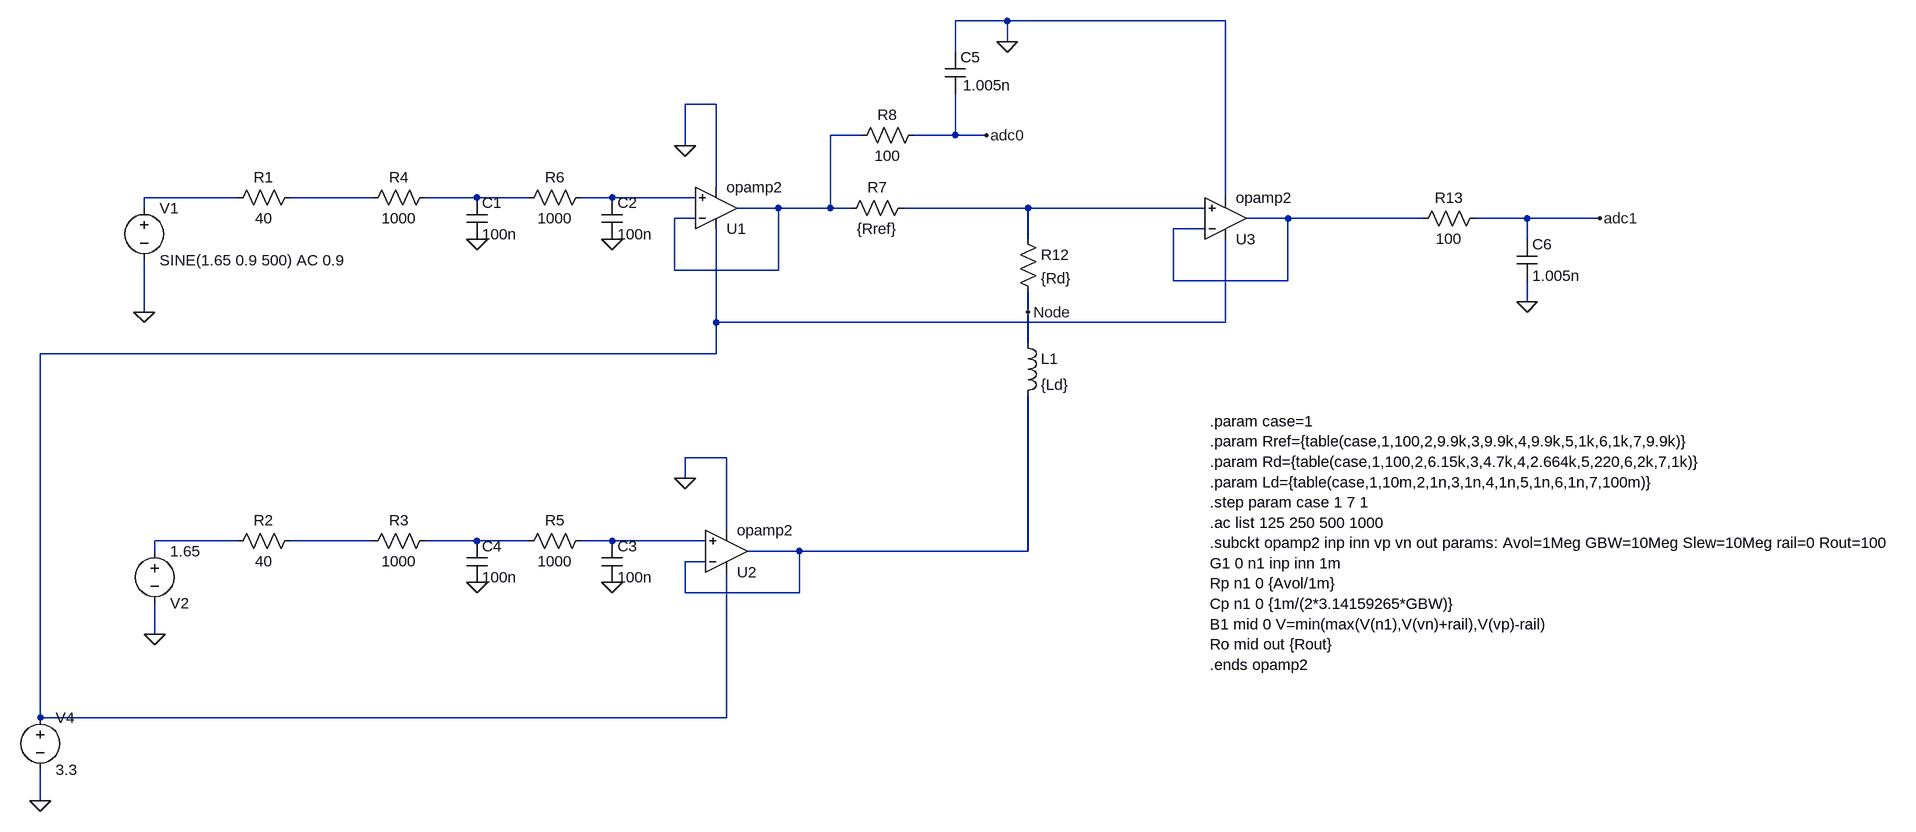
[diagram p0: schematic Impedence_Measurement.asc]
Impedence_Measurement.asc, the LTspice schematic file:
Version 4
SHEET 1 2552 900
WIRE 992 -320 912 -320
WIRE 1328 -320 992 -320
WIRE 992 -288 992 -320
WIRE 912 -272 912 -320
WIRE 544 -192 496 -192
WIRE 768 -144 720 -144
WIRE 912 -144 912 -208
WIRE 912 -144 848 -144
WIRE 960 -144 912 -144
WIRE 496 -128 496 -192
WIRE 544 -64 544 -192
WIRE -192 -48 -336 -48
WIRE 16 -48 -112 -48
WIRE 176 -48 96 -48
WIRE 256 -48 176 -48
WIRE 384 -48 336 -48
WIRE 512 -48 384 -48
WIRE 1328 -48 1328 -320
WIRE -336 -32 -336 -48
WIRE 640 -32 576 -32
WIRE 720 -32 720 -144
WIRE 720 -32 640 -32
WIRE 752 -32 720 -32
WIRE 1024 -32 832 -32
WIRE 1296 -32 1024 -32
WIRE 512 -16 480 -16
WIRE 1424 -16 1360 -16
WIRE 1632 -16 1424 -16
WIRE 1792 -16 1712 -16
WIRE 1904 -16 1792 -16
WIRE 1296 0 1248 0
WIRE 1024 16 1024 -32
WIRE 1792 16 1792 -16
WIRE 480 64 480 -16
WIRE 640 64 640 -32
WIRE 640 64 480 64
WIRE 1248 80 1248 0
WIRE 1424 80 1424 -16
WIRE 1424 80 1248 80
WIRE 1792 112 1792 80
WIRE -336 128 -336 48
WIRE 1024 128 1024 96
WIRE 544 144 544 0
WIRE 1328 144 1328 16
WIRE 1328 144 544 144
WIRE 1024 176 1024 128
WIRE 544 192 544 144
WIRE 544 192 -496 192
WIRE 560 352 496 352
WIRE 496 384 496 352
WIRE 560 464 560 352
WIRE -192 480 -320 480
WIRE 16 480 -112 480
WIRE 176 480 96 480
WIRE 256 480 176 480
WIRE 384 480 336 480
WIRE 528 480 384 480
WIRE -320 496 -320 480
WIRE 672 496 592 496
WIRE 1024 496 1024 256
WIRE 1024 496 672 496
WIRE 528 512 496 512
WIRE 496 560 496 512
WIRE 672 560 672 496
WIRE 672 560 496 560
WIRE -320 624 -320 576
WIRE -496 752 -496 192
WIRE 560 752 560 528
WIRE 560 752 -496 752
WIRE -496 880 -496 832
FLAG -320 624 0
FLAG -336 128 0
FLAG 176 16 0
FLAG 384 16 0
FLAG 176 544 0
FLAG 384 544 0
FLAG 992 -288 0
FLAG 1792 112 0
FLAG -496 880 0
FLAG 496 -128 0
FLAG 496 384 0
FLAG 960 -144 adc0
FLAG 1904 -16 adc1
FLAG 1024 128 Node
SYMBOL voltage -336 -48 R0
WINDOW 123 0 0 Left 0
WINDOW 39 0 0 Left 0
SYMATTR InstName V1
SYMATTR Value SINE(1.65 0.9 500) AC 0.9
SYMBOL res -96 -64 R90
WINDOW 0 0 56 VBottom 2
WINDOW 3 32 56 VTop 2
SYMATTR InstName R1
SYMATTR Value 40
SYMBOL res -96 464 R90
WINDOW 0 0 56 VBottom 2
WINDOW 3 32 56 VTop 2
SYMATTR InstName R2
SYMATTR Value 40
SYMBOL res 112 464 R90
WINDOW 0 0 56 VBottom 2
WINDOW 3 32 56 VTop 2
SYMATTR InstName R3
SYMATTR Value 1000
SYMBOL res 112 -64 R90
WINDOW 0 0 56 VBottom 2
WINDOW 3 32 56 VTop 2
SYMATTR InstName R4
SYMATTR Value 1000
SYMBOL res 352 464 R90
WINDOW 0 0 56 VBottom 2
WINDOW 3 32 56 VTop 2
SYMATTR InstName R5
SYMATTR Value 1000
SYMBOL res 352 -64 R90
WINDOW 0 0 56 VBottom 2
WINDOW 3 32 56 VTop 2
SYMATTR InstName R6
SYMATTR Value 1000
SYMBOL cap 160 -48 R0
SYMATTR InstName C1
SYMATTR Value 100n
SYMBOL cap 368 -48 R0
SYMATTR InstName C2
SYMATTR Value 100n
SYMBOL cap 368 480 R0
SYMATTR InstName C3
SYMATTR Value 100n
SYMBOL cap 160 480 R0
SYMATTR InstName C4
SYMATTR Value 100n
SYMBOL OpAmps\\opamp2 544 32 M180
SYMATTR InstName U1
SYMATTR Value2 Avol=100k GBW=1Meg Slew=0.6Meg rail=25m
SYMBOL OpAmps\\opamp2 560 560 M180
SYMATTR InstName U2
SYMATTR Value2 Avol=100k GBW=1Meg Slew=0.6Meg rail=25m
SYMBOL res 848 -48 R90
WINDOW 0 0 56 VBottom 2
WINDOW 3 32 56 VTop 2
SYMATTR InstName R7
SYMATTR Value {Rref}
SYMBOL res 864 -160 R90
WINDOW 0 0 56 VBottom 2
WINDOW 3 32 56 VTop 2
SYMATTR InstName R8
SYMATTR Value 100
SYMBOL cap 896 -272 R0
WINDOW 3 28 51 Left 2
SYMATTR Value 1.005n
SYMATTR InstName C5
SYMBOL OpAmps\\opamp2 1328 48 M180
SYMATTR InstName U3
SYMATTR Value2 Avol=100k GBW=1Meg Slew=0.6Meg rail=25m
SYMBOL res 1008 0 R0
SYMATTR InstName R12
SYMATTR Value {Rd}
SYMBOL ind 1008 160 R0
SYMATTR InstName L1
SYMATTR Value {Ld}
SYMBOL res 1728 -32 R90
WINDOW 0 0 56 VBottom 2
WINDOW 3 32 56 VTop 2
SYMATTR InstName R13
SYMATTR Value 100
SYMBOL cap 1776 16 R0
SYMATTR InstName C6
SYMATTR Value 1.005n
SYMBOL voltage -496 736 R0
WINDOW 123 0 0 Left 0
WINDOW 39 0 0 Left 0
SYMATTR InstName V4
SYMATTR Value 3.3
SYMBOL voltage -320 480 R0
WINDOW 0 24 96 Left 2
WINDOW 3 24 16 Left 2
WINDOW 123 0 0 Left 0
WINDOW 39 0 0 Left 0
SYMATTR InstName V2
SYMATTR Value 1.65
TEXT 1304 296 Left 2 !.param case=1\n.param Rref={table(case,1,100,2,9.9k,3,9.9k,4,9.9k,5,1k,6,1k,7,9.9k)}\n.param Rd={table(case,1,100,2,6.15k,3,4.7k,4,2.664k,5,220,6,2k,7,1k)}\n.param Ld={table(case,1,10m,2,1n,3,1n,4,1n,5,1n,6,1n,7,100m)}\n.step param case 1 7 1\n.ac list 125 250 500 1000\n.subckt opamp2 inp inn vp vn out params: Avol=1Meg GBW=10Meg Slew=10Meg rail=0 Rout=100\nG1 0 n1 inp inn 1m\nRp n1 0 {Avol/1m}\nCp n1 0 {1m/(2*3.14159265*GBW)}\nB1 mid 0 V=min(max(V(n1),V(vn)+rail),V(vp)-rail)\nRo mid out {Rout}\n.ends opamp2

The netlist it stands for:
* Impedence_Measurement.asc
V1 N002 0 SINE(1.65 0.9 500) AC 0.9
R1 N003 N002 40
R2 N010 N009 40
R3 N011 N010 1000
R4 N004 N003 1000
R5 N012 N011 1000
R6 N005 N004 1000
C1 N004 0 100n
C2 N005 0 100n
C3 N012 0 100n
C4 N011 0 100n
XU1 N005 N001 N008 0 N001 opamp2 Avol=100k GBW=1Meg Slew=0.6Meg rail=25m  ; pins In+ In- V+ V- OUT
XU2 N012 N013 N008 0 N013 opamp2 Avol=100k GBW=1Meg Slew=0.6Meg rail=25m  ; pins In+ In- V+ V- OUT
R7 N006 N001 {Rref}
R8 adc0 N001 100
C5 0 adc0 1.005n
XU3 N006 N007 N008 0 N007 opamp2 Avol=100k GBW=1Meg Slew=0.6Meg rail=25m  ; pins In+ In- V+ V- OUT
R12 N006 Node {Rd}
L1 Node N013 {Ld}
R13 adc1 N007 100
C6 adc1 0 1.005n
V4 N008 0 3.3
V2 N009 0 1.65
.param case=1
.param Rref={table(case,1,100,2,9.9k,3,9.9k,4,9.9k,5,1k,6,1k,7,9.9k)}
.param Rd={table(case,1,100,2,6.15k,3,4.7k,4,2.664k,5,220,6,2k,7,1k)}
.param Ld={table(case,1,10m,2,1n,3,1n,4,1n,5,1n,6,1n,7,100m)}
.step param case 1 7 1
.ac list 125 250 500 1000
.subckt opamp2 inp inn vp vn out params: Avol=1Meg GBW=10Meg Slew=10Meg rail=0 Rout=100
G1 0 n1 inp inn 1m
Rp n1 0 {Avol/1m}
Cp n1 0 {1m/(2*3.14159265*GBW)}
B1 mid 0 V=min(max(V(n1),V(vn)+rail),V(vp)-rail)
Ro mid out {Rout}
.ends opamp2
.backanno
.end

* Results of the author's LTspice run, read from the files saved beside the schematic
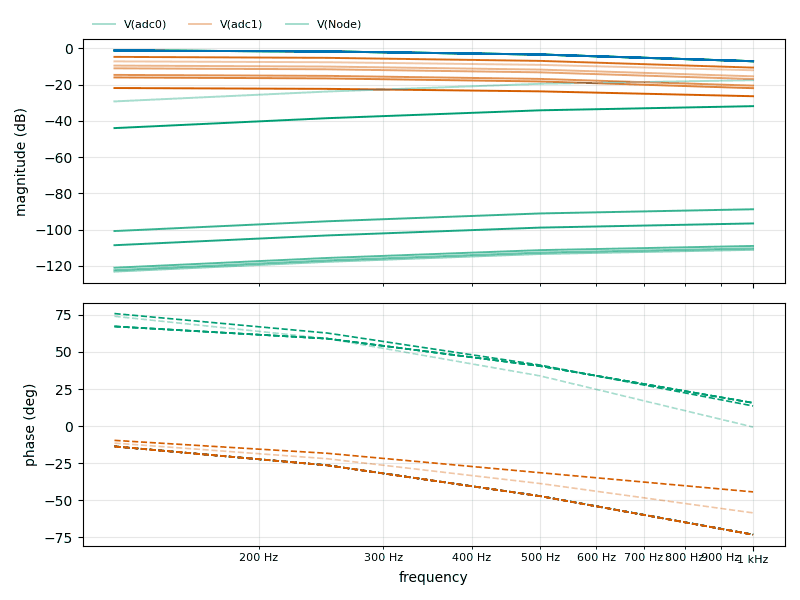
[diagram p1: AC Analysis of Impedence_Measurement.asc, plotted from the saved traces]
* AC Analysis, 7 runs:
*   V(adc0) [case=1]: -1.11 dB at 125 Hz, -7.04 dB at 1 kHz, peak -1.11 dB at 125 Hz, 3 dB below the peak at 580 Hz
*   V(adc0) [case=2]: -1.11 dB at 125 Hz, -7.04 dB at 1 kHz, peak -1.11 dB at 125 Hz, 3 dB below the peak at 580.1 Hz
*   V(adc0) [case=3]: -1.11 dB at 125 Hz, -7.04 dB at 1 kHz, peak -1.11 dB at 125 Hz, 3 dB below the peak at 580.1 Hz
*   V(adc0) [case=4]: -1.11 dB at 125 Hz, -7.04 dB at 1 kHz, peak -1.11 dB at 125 Hz, 3 dB below the peak at 580.1 Hz
*   V(adc0) [case=5]: -1.11 dB at 125 Hz, -7.04 dB at 1 kHz, peak -1.11 dB at 125 Hz, 3 dB below the peak at 580.1 Hz
*   V(adc0) [case=6]: -1.11 dB at 125 Hz, -7.04 dB at 1 kHz, peak -1.11 dB at 125 Hz, 3 dB below the peak at 580.1 Hz
*   V(adc0) [case=7]: -1.11 dB at 125 Hz, -7.04 dB at 1 kHz, peak -1.11 dB at 125 Hz, 3 dB below the peak at 580.1 Hz
*   V(adc1) [case=1]: -7.11 dB at 125 Hz, -12.02 dB at 1 kHz, peak -7.11 dB at 125 Hz, 3 dB below the peak at 642.8 Hz
*   V(adc1) [case=2]: -9.44 dB at 125 Hz, -15.37 dB at 1 kHz, peak -9.44 dB at 125 Hz, 3 dB below the peak at 580.1 Hz
*   V(adc1) [case=3]: -10.95 dB at 125 Hz, -16.88 dB at 1 kHz, peak -10.95 dB at 125 Hz, 3 dB below the peak at 580.1 Hz
*   V(adc1) [case=4]: -14.58 dB at 125 Hz, -20.51 dB at 1 kHz, peak -14.58 dB at 125 Hz, 3 dB below the peak at 580.1 Hz
*   V(adc1) [case=5]: -15.99 dB at 125 Hz, -21.91 dB at 1 kHz, peak -15.99 dB at 125 Hz, 3 dB below the peak at 580.1 Hz
*   V(adc1) [case=6]: -4.63 dB at 125 Hz, -10.56 dB at 1 kHz, peak -4.63 dB at 125 Hz, 3 dB below the peak at 580.1 Hz
*   V(adc1) [case=7]: -21.83 dB at 125 Hz, -26.35 dB at 1 kHz, peak -21.83 dB at 125 Hz, 3 dB below the peak at 677 Hz
*   V(Node) [case=1]: -29.22 dB at 125 Hz, -17.49 dB at 1 kHz, peak -17.49 dB at 1 kHz, 3 dB below the peak at 424.6 Hz
*   V(Node) [case=2]: -123.17 dB at 125 Hz, -111.14 dB at 1 kHz, peak -111.14 dB at 1 kHz, 3 dB below the peak at 446.5 Hz
*   V(Node) [case=3]: -122.35 dB at 125 Hz, -110.32 dB at 1 kHz, peak -110.32 dB at 1 kHz, 3 dB below the peak at 446.5 Hz
*   V(Node) [case=4]: -121.04 dB at 125 Hz, -109.02 dB at 1 kHz, peak -109.02 dB at 1 kHz, 3 dB below the peak at 446.5 Hz
*   V(Node) [case=5]: -100.79 dB at 125 Hz, -88.76 dB at 1 kHz, peak -88.76 dB at 1 kHz, 3 dB below the peak at 446.5 Hz
*   V(Node) [case=6]: -108.60 dB at 125 Hz, -96.58 dB at 1 kHz, peak -96.58 dB at 1 kHz, 3 dB below the peak at 446.5 Hz
*   V(Node) [case=7]: -43.96 dB at 125 Hz, -31.83 dB at 1 kHz, peak -31.83 dB at 1 kHz, 3 dB below the peak at 446.3 Hz